# Altium project Vibration_Datalogger.PrjPcb (part 3 of 7)
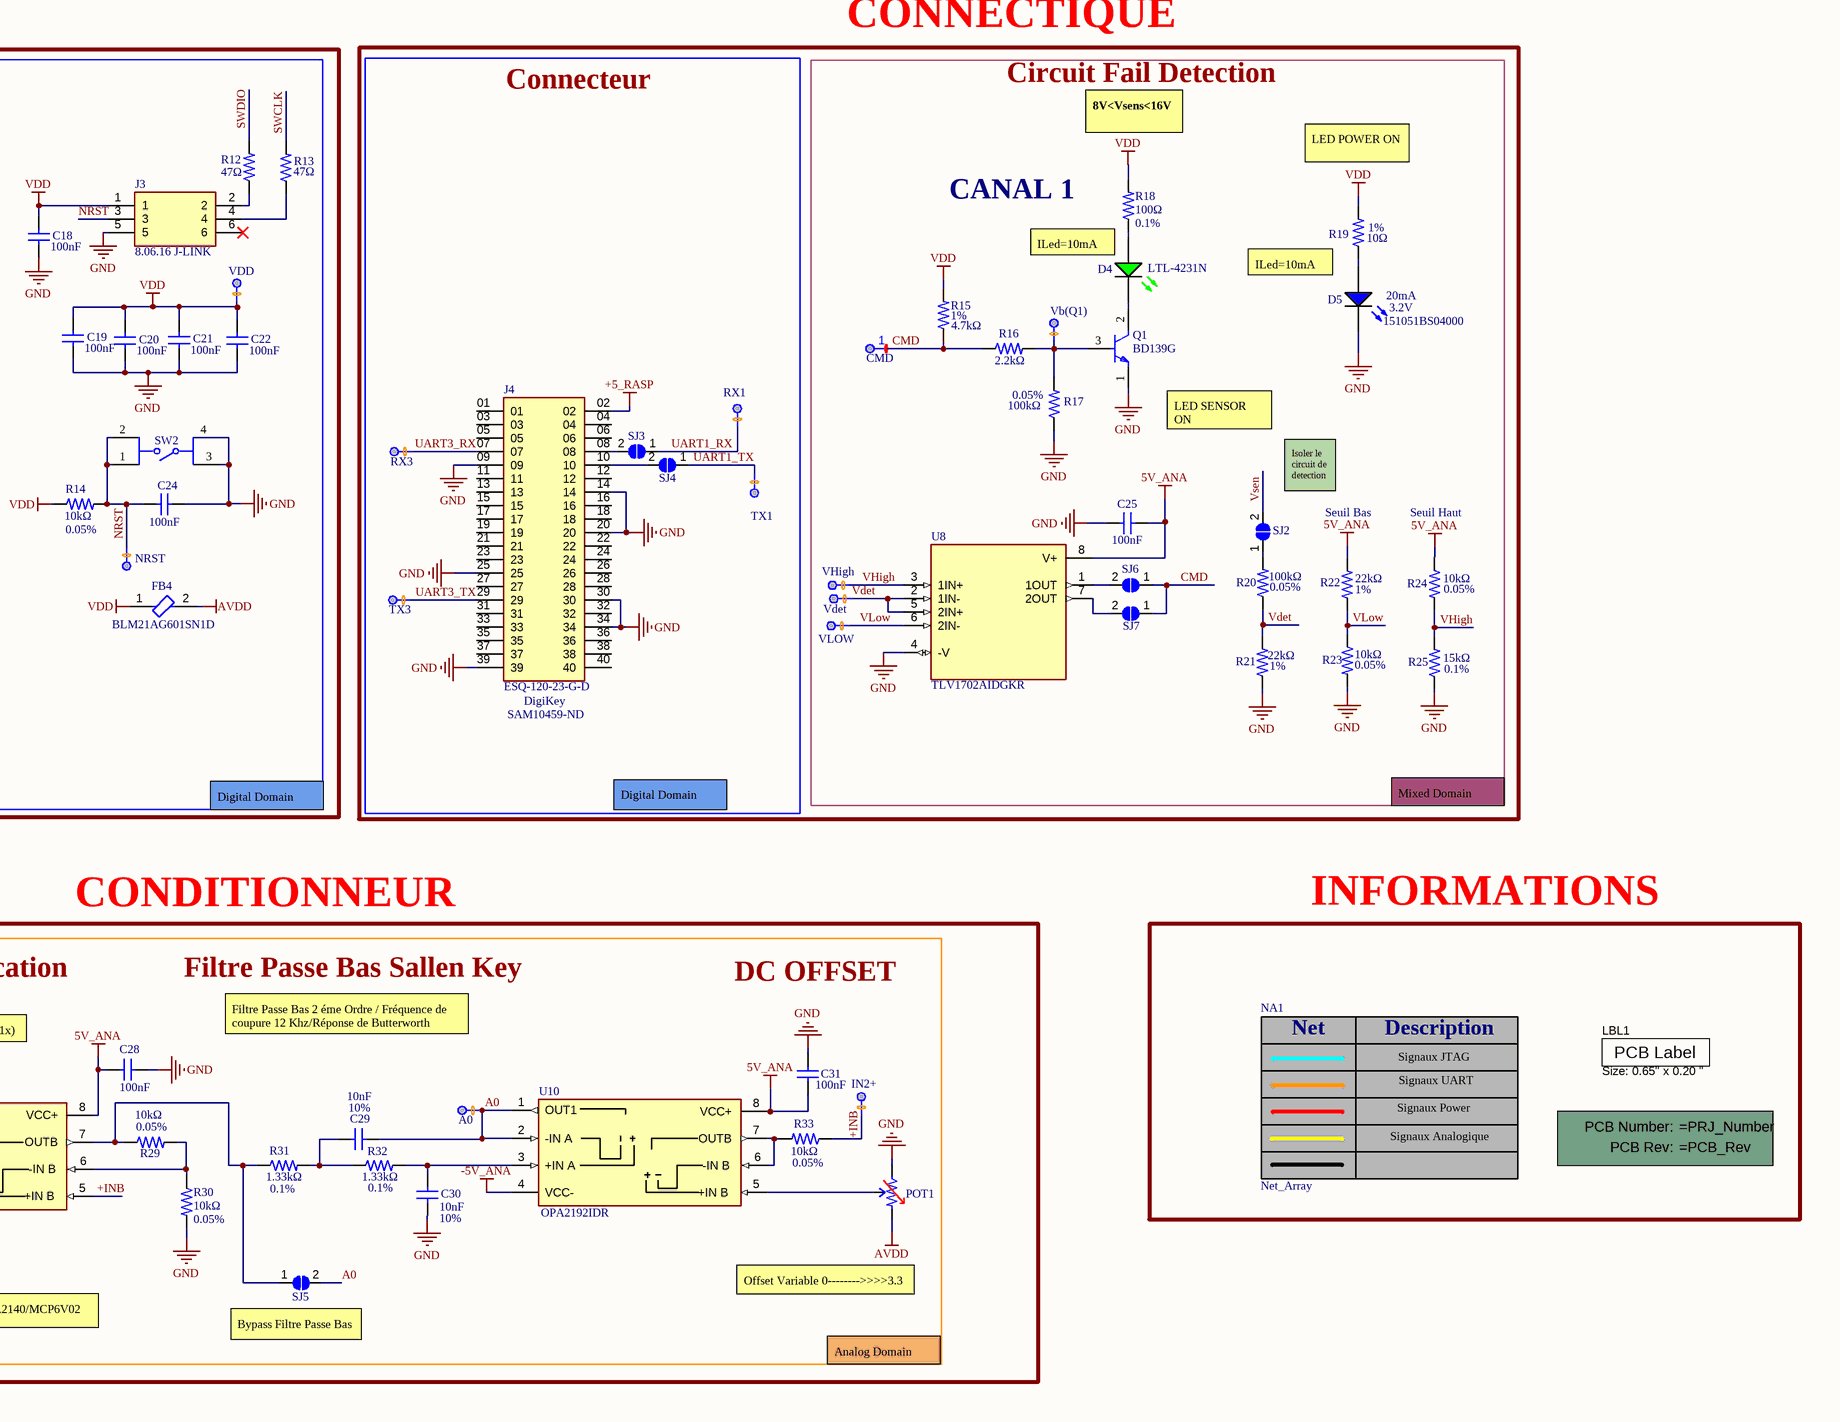
[diagram p5: Vibration_Datalogger_1.SchDoc, bottom right]

## Sheet Vibration_Datalogger_1.SchDoc: Title (continued)

### Library data of the parts (continued)
C27 C28 C31 = CC0402KRX7R7BB104: CAP CER 0.1UF 16V X7R 0402; Manufacturer: Yageo Group; Dielectric Material: Ceramic; Temperature Coefficient: 30ppm/°C; Tolerance: 10%; Case/Package: 0402; Case Code (Imperial): 0402; Case Code (Metric): 1005; China RoHS: Compliant; Composition: Ceramic; Country of Origin: Mainland China, Taiwan; Depth: 500µm; Export Control Classification Number (ECCN) Code: EAR99; Halogen Free: Halogen Free; Height: 500µm; Harmonized Tariff Schedule (HTS) Code: 8532.24.00.20; Introduction Date: 2009-04-17; Lead Free: Lead Free; Length: 1mm; Lifecycle Status: Production; Material: Ceramic; Max Operating Temperature: 125°C; Min Operating Temperature: -55°C; Mount: Surface Mount; Number of Pins: 2; Number of Terminals: 2; Radiation Hardening: No; REACH SVHC: Yes; Schedule B: 8532240020, 8532240020|8532240020, 8532240020|8532240020|8532240020, 8532240020|8532240020|8532240020|8532240020; Termination: SMD/SMT; Thickness: 558.8µm; Voltage Rating: 16V; Voltage Rating (AC): 16V; Voltage Rating (DC): 16V; Width: 500µm; ComponentLink1URL: https://datasheet.octopart.com:443/CC0402KRX7R7BB104-Yageo-datasheet-177165144.pdf?src-supplier=IHS; ComponentLink1Description: https://datasheet.octopart.com:443/CC0402KRX7R7BB104-Yageo-datasheet-177165144.pdf?src-supplier=IHS; ComponentLink2URL: https://datasheet.octopart.com/CC0402KRX7R7BB104-Yageo-datasheet-10883670.pdf; ComponentLink2Description: https://datasheet.octopart.com/CC0402KRX7R7BB104-Yageo-datasheet-10883670.pdf; ComponentLink3URL: https://datasheet.octopart.com/CC0402KRX7R7BB104-Yageo-datasheet-12526321.pdf; ComponentLink3Description: https://datasheet.octopart.com/CC0402KRX7R7BB104-Yageo-datasheet-12526321.pdf; ComponentLink4URL: https://datasheet.octopart.com:443/CC0402KRX7R7BB104-Yageo-datasheet-82288757.pdf?src-supplier=Upverter; ComponentLink4Description: https://datasheet.octopart.com:443/CC0402KRX7R7BB104-Yageo-datasheet-82288757.pdf?src-supplier=Upverter; ComponentLink5URL: https://datasheet.octopart.com:443/CC0402KRX7R7BB104-Yageo-datasheet-78855684.pdf?src-supplier=Upverter; ComponentLink5Description: https://datasheet.octopart.com:443/CC0402KRX7R7BB104-Yageo-datasheet-78855684.pdf?src-supplier=Upverter; ComponentLink6URL: https://datasheet.octopart.com:443/CC0402KRX7R7BB104-Yageo-datasheet-68298032.pdf?src-supplier=Upverter; ComponentLink6Description: https://datasheet.octopart.com:443/CC0402KRX7R7BB104-Yageo-datasheet-68298032.pdf?src-supplier=Upverter; ComponentLink7URL: https://datasheet.octopart.com:443/CC0402KRX7R7BB104-Yageo-datasheet-181967370.pdf?src-supplier=Newark; ComponentLink7Description: https://datasheet.octopart.com:443/CC0402KRX7R7BB104-Yageo-datasheet-181967370.pdf?src-supplier=Newark; ComponentLink8URL: https://datasheet.octopart.com:443/CC0402KRX7R7BB104-Yageo-datasheet-181967368.pdf?src-supplier=Newark; ComponentLink8Description: https://datasheet.octopart.com:443/CC0402KRX7R7BB104-Yageo-datasheet-181967368.pdf?src-supplier=Newark; ComponentLink9URL: https://datasheet.octopart.com:443/CC0402KRX7R7BB104-Yageo-datasheet-499490.pdf?src-supplier=Newark; ComponentLink9Description: https://datasheet.octopart.com:443/CC0402KRX7R7BB104-Yageo-datasheet-499490.pdf?src-supplier=Newark; ComponentLink10URL: https://datasheet.octopart.com:443/CC0402KRX7R7BB104-Yageo-datasheet-519481.pdf?src-supplier=Newark; ComponentLink10Description: https://datasheet.octopart.com:443/CC0402KRX7R7BB104-Yageo-datasheet-519481.pdf?src-supplier=Newark; ComponentLink11URL: https://datasheet.octopart.com:443/CC0402KRX7R7BB104-Yageo-datasheet-182050774.pdf?src-supplier=Newark; ComponentLink11Description: https://datasheet.octopart.com:443/CC0402KRX7R7BB104-Yageo-datasheet-182050774.pdf?src-supplier=Newark; ComponentLink12URL: https://datasheet.octopart.com:443/CC0402KRX7R7BB104-Yageo-datasheet-62336348.pdf?src-supplier=Farnell; ComponentLink12Description: https://datasheet.octopart.com:443/CC0402KRX7R7BB104-Yageo-datasheet-62336348.pdf?src-supplier=Farnell; ComponentLink13URL: https://datasheet.octopart.com:443/CC0402KRX7R7BB104-Yageo-datasheet-151948686.pdf?src-supplier=Farnell; ComponentLink13Description: https://datasheet.octopart.com:443/CC0402KRX7R7BB104-Yageo-datasheet-151948686.pdf?src-supplier=Farnell; ComponentLink14URL: https://datasheet.octopart.com:443/CC0402KRX7R7BB104-Yageo-Group-datasheet-188689702.pdf?src-supplier=Farnell; ComponentLink14Description: https://datasheet.octopart.com:443/CC0402KRX7R7BB104-Yageo-Group-datasheet-188689702.pdf?src-supplier=Farnell; ComponentLink15URL: https://datasheet.octopart.com:443/CC0402KRX7R7BB104-Yageo-datasheet-8359971.pdf?src-supplier=Farnell; ComponentLink15Description: https://datasheet.octopart.com:443/CC0402KRX7R7BB104-Yageo-datasheet-8359971.pdf?src-supplier=Farnell; ComponentLink16URL: https://datasheet.octopart.com:443/CC0402KRX7R7BB104-Yageo-datasheet-500777.pdf?src-supplier=Farnell; ComponentLink16Description: https://datasheet.octopart.com:443/CC0402KRX7R7BB104-Yageo-datasheet-500777.pdf?src-supplier=Farnell; ComponentLink17URL: https://datasheet.octopart.com:443/CC0402KRX7R7BB104-Yageo-datasheet-137700084.pdf?src-supplier=Burklin+Elektronik; ComponentLink17Description: https://datasheet.octopart.com:443/CC0402KRX7R7BB104-Yageo-datasheet-137700084.pdf?src-supplier=Burklin+Elektronik; ComponentLink18URL: https://datasheet.octopart.com:443/CC0402KRX7R7BB104-Yageo-datasheet-27626582.pdf?src-supplier=Future+Electronics; ComponentLink18Description: https://datasheet.octopart.com:443/CC0402KRX7R7BB104-Yageo-datasheet-27626582.pdf?src-supplier=Future+Electronics; ComponentLink19URL: https://datasheet.octopart.com:443/CC0402KRX7R7BB104-Yageo-datasheet-166511530.pdf?src-supplier=Future+Electronics; ComponentLink19Description: https://datasheet.octopart.com:443/CC0402KRX7R7BB104-Yageo-datasheet-166511530.pdf?src-supplier=Future+Electronics; ComponentLink20URL: https://datasheet.octopart.com:443/CC0402KRX7R7BB104-Yageo-datasheet-137700082.pdf?src-supplier=Future+Electronics; ComponentLink20Description: https://datasheet.octopart.com:443/CC0402KRX7R7BB104-Yageo-datasheet-137700082.pdf?src-supplier=Future+Electronics; ComponentLink21URL: https://datasheet.octopart.com:443/CC0402KRX7R7BB104-Yageo-datasheet-24578986.pdf?src-supplier=Future+Electronics; ComponentLink21Description: https://datasheet.octopart.com:443/CC0402KRX7R7BB104-Yageo-datasheet-24578986.pdf?src-supplier=Future+Electronics; ComponentLink22URL: https://datasheet.octopart.com:443/CC0402KRX7R7BB104-Yageo-datasheet-10911834.pdf?src-supplier=Future+Electronics; ComponentLink22Description: https://datasheet.octopart.com:443/CC0402KRX7R7BB104-Yageo-datasheet-10911834.pdf?src-supplier=Future+Electronics; ComponentLink23URL: https://datasheet.octopart.com:443/CC0402KRX7R7BB104-Yageo-datasheet-8324442.pdf?src-supplier=Future+Electronics; ComponentLink23Description: https://datasheet.octopart.com:443/CC0402KRX7R7BB104-Yageo-datasheet-8324442.pdf?src-supplier=Future+Electronics; ComponentLink24URL: https://datasheet.octopart.com:443/CC0402KRX7R7BB104-Yageo-datasheet-15895757.pdf?src-supplier=element14+APAC; ComponentLink24Description: https://datasheet.octopart.com:443/CC0402KRX7R7BB104-Yageo-datasheet-15895757.pdf?src-supplier=element14+APAC; ComponentLink25URL: https://datasheet.octopart.com:443/CC0402KRX7R7BB104-Yageo-Group-datasheet-184163374.pdf?src-supplier=LCSC; ComponentLink25Description: https://datasheet.octopart.com:443/CC0402KRX7R7BB104-Yageo-Group-datasheet-184163374.pdf?src-supplier=LCSC; ComponentLink26URL: https://datasheet.octopart.com:443/CC0402KRX7R7BB104-Yageo-Group-datasheet-165992755.pdf?src-supplier=ODG+(Origin+Data+Global); ComponentLink26Description: https://datasheet.octopart.com:443/CC0402KRX7R7BB104-Yageo-Group-datasheet-165992755.pdf?src-supplier=ODG+(Origin+Data+Global); ComponentLink27URL: https://datasheet.octopart.com:443/CC0402KRX7R7BB104-Yageo-datasheet-140260305.pdf?src-supplier=SOS+electronic; ComponentLink27Description: https://datasheet.octopart.com:443/CC0402KRX7R7BB104-Yageo-datasheet-140260305.pdf?src-supplier=SOS+electronic; ComponentLink28URL: https://datasheet.octopart.com:443/CC0402KRX7R7BB104-Yageo-datasheet-151978998.pdf?src-supplier=SOS+electronic; ComponentLink28Description: https://datasheet.octopart.com:443/CC0402KRX7R7BB104-Yageo-datasheet-151978998.pdf?src-supplier=SOS+electronic; ComponentLink29URL: https://datasheet.octopart.com:443/CC0402KRX7R7BB104-Yageo-datasheet-8701427.pdf?src-supplier=element14; ComponentLink29Description: https://datasheet.octopart.com:443/CC0402KRX7R7BB104-Yageo-datasheet-8701427.pdf?src-supplier=element14; ComponentLink30URL: https://datasheet.octopart.com:443/CC0402KRX7R7BB104-Yageo-datasheet-5301394.pdf?src-supplier=element14; ComponentLink30Description: https://datasheet.octopart.com:443/CC0402KRX7R7BB104-Yageo-datasheet-5301394.pdf?src-supplier=element14; ComponentLink31URL: http://sigma.octopart.com:80/rohs_statement/Surface-Mount-Ceramic-Multilayer-Capacitors%3B-General-Purpose-%26-High-Capacitance-Class-2%2C-X7R-Yageo-family-124.pdf?src-supplier=Compliance+Statements; ComponentLink31Description: http://sigma.octopart.com:80/rohs_statement/Surface-Mount-Ceramic-Multilayer-Capacitors%3B-General-Purpose-%26-High-Capacitance-Class-2%2C-X7R-Yageo-family-124.pdf?src-supplier=Compliance+Statements; ComponentLink32URL: http://sigma.octopart.com:80/reach_statement/Surface-Mount-Ceramic-Multilayer-Capacitors%3B-General-Purpose-%26-High-Capacitance-Class-2%2C-X7R-Yageo-family-125.pdf?src-supplier=Compliance+Statements; ComponentLink32Description: http://sigma.octopart.com:80/reach_statement/Surface-Mount-Ceramic-Multilayer-Capacitors%3B-General-Purpose-%26-High-Capacitance-Class-2%2C-X7R-Yageo-family-125.pdf?src-supplier=Compliance+Statements; ComponentLink33URL: http://sigma.octopart.com:80/conflict_mineral_statement/Yageo-company-3.pdf?src-supplier=Compliance+Statements; ComponentLink33Description: http://sigma.octopart.com:80/conflict_mineral_statement/Yageo-company-3.pdf?src-supplier=Compliance+Statements; ComponentLink34URL: http://sigma.octopart.com:80/rohs_statement/Yageo-company-2.pdf?src-supplier=Compliance+Statements; ComponentLink34Description: http://sigma.octopart.com:80/rohs_statement/Yageo-company-2.pdf?src-supplier=Compliance+Statements; Supplier 1: DigiKey; Supplier Part Number 1: 311-1338-6-ND; Manufacturer Part Number: CC0402KRX7R7BB104; Category: Ceramic Capacitors; Voltage: 16V; Dielectric: X7R
C29 C30 = C0603C103K5RAC7411: CAP CER 10000PF 50V X7R 0603; Dielectric Material: Ceramic; Dissipation Factor: 2.5%; Temperature Coefficient: 30ppm/°C; Case/Package: 0603; Case Code (Imperial): 0603; Case Code (Metric): 1608; China RoHS: Compliant; Country of Origin: Mexico; Depth: 800µm; Dielectric: X7R; Export Control Classification Number (ECCN) Code: EAR99; Height: 800µm; Harmonized Tariff Schedule (HTS) Code: 8532.24.00.20; Introduction Date: 2011-03-01; Lead Pitch: 700µm; Length: 1.6mm; Lifecycle Status: Production; Material: Ceramic; Max Operating Temperature: 125°C; Min Operating Temperature: -55°C; Mount: Surface Mount; Number of Terminals: 2; Radiation Hardening: No; REACH SVHC: Yes; Schedule B: 8532240020, 8532240020|8532240020|8532240020|8532240020|8532240020; Termination: SMD/SMT; Voltage Rating: 50V; Voltage Rating (DC): 50V; Width: 800µm; ComponentLink1URL: https://datasheet.octopart.com:443/C0603C103K5RAC7411-KEMET-datasheet-178445679.pdf?src-supplier=IHS; ComponentLink1Description: https://datasheet.octopart.com:443/C0603C103K5RAC7411-KEMET-datasheet-178445679.pdf?src-supplier=IHS; ComponentLink2URL: https://datasheet.octopart.com:443/C0603C103K5RAC7411-KEMET-datasheet-137357764.pdf?src-supplier=Upverter; ComponentLink2Description: https://datasheet.octopart.com:443/C0603C103K5RAC7411-KEMET-datasheet-137357764.pdf?src-supplier=Upverter; ComponentLink3URL: https://datasheet.octopart.com:443/C0603C103K5RAC7411-KEMET-datasheet-149521829.pdf?src-supplier=Farnell; ComponentLink3Description: https://datasheet.octopart.com:443/C0603C103K5RAC7411-KEMET-datasheet-149521829.pdf?src-supplier=Farnell; ComponentLink4URL: https://datasheet.octopart.com:443/C0603C103K5RAC7411-KEMET-datasheet-137357759.pdf?src-supplier=Farnell; ComponentLink4Description: https://datasheet.octopart.com:443/C0603C103K5RAC7411-KEMET-datasheet-137357759.pdf?src-supplier=Farnell; ComponentLink5URL: https://datasheet.octopart.com:443/C0603C103K5RAC7411-KEMET-datasheet-157246124.pdf?src-supplier=Electro+Sonic; ComponentLink5Description: https://datasheet.octopart.com:443/C0603C103K5RAC7411-KEMET-datasheet-157246124.pdf?src-supplier=Electro+Sonic; ComponentLink6URL: https://datasheet.octopart.com:443/C0603C103K5RAC7411-KEMET-datasheet-37550250.pdf?src-supplier=Electro+Sonic; ComponentLink6Description: https://datasheet.octopart.com:443/C0603C103K5RAC7411-KEMET-datasheet-37550250.pdf?src-supplier=Electro+Sonic; ComponentLink7URL: https://datasheet.octopart.com:443/C0603C103K5RAC7411-KEMET-datasheet-188512054.pdf?src-supplier=ODG+(Origin+Data+Global); ComponentLink7Description: https://datasheet.octopart.com:443/C0603C103K5RAC7411-KEMET-datasheet-188512054.pdf?src-supplier=ODG+(Origin+Data+Global); ComponentLink8URL: https://datasheet.octopart.com:443/C0603C103K5RAC7411-KEMET-datasheet-166018733.pdf?src-supplier=Newark; ComponentLink8Description: https://datasheet.octopart.com:443/C0603C103K5RAC7411-KEMET-datasheet-166018733.pdf?src-supplier=Newark; ComponentLink9URL: https://datasheet.octopart.com:443/C0603C103K5RAC7411-KEMET-datasheet-137045076.pdf?src-supplier=TME; ComponentLink9Description: https://datasheet.octopart.com:443/C0603C103K5RAC7411-KEMET-datasheet-137045076.pdf?src-supplier=TME; ComponentLink10URL: https://datasheet.octopart.com:443/C0603C103K5RAC7411-KEMET-datasheet-130256537.pdf?src-supplier=TME; ComponentLink10Description: https://datasheet.octopart.com:443/C0603C103K5RAC7411-KEMET-datasheet-130256537.pdf?src-supplier=TME; ComponentLink11URL: https://datasheet.octopart.com/C0603C103K5RAC7411-KEMET-datasheet-84169754.pdf; ComponentLink11Description: https://datasheet.octopart.com/C0603C103K5RAC7411-KEMET-datasheet-84169754.pdf; ComponentLink12URL: https://datasheet.octopart.com:443/C0603C103K5RAC7411-Kemet-datasheet-11777752.pdf?src-supplier=Arrow+Electronics; ComponentLink12Description: https://datasheet.octopart.com:443/C0603C103K5RAC7411-Kemet-datasheet-11777752.pdf?src-supplier=Arrow+Electronics; ComponentLink13URL: https://datasheet.octopart.com:443/C0603C103K5RAC7411-Kemet-datasheet-5313890.pdf?src-supplier=Verical; ComponentLink13Description: https://datasheet.octopart.com:443/C0603C103K5RAC7411-Kemet-datasheet-5313890.pdf?src-supplier=Verical; ComponentLink14URL: https://datasheet.octopart.com:443/C0603C103K5RAC-7411-Kemet-datasheet-7834772.pdf?src-supplier=Jameco; ComponentLink14Description: https://datasheet.octopart.com:443/C0603C103K5RAC-7411-Kemet-datasheet-7834772.pdf?src-supplier=Jameco; ComponentLink15URL: http://sigma.octopart.com:80/conflict_mineral_statement/Yageo-company-3.pdf?src-supplier=Compliance+Statements; ComponentLink15Description: http://sigma.octopart.com:80/conflict_mineral_statement/Yageo-company-3.pdf?src-supplier=Compliance+Statements; ComponentLink16URL: http://sigma.octopart.com:80/rohs_statement/Yageo-company-2.pdf?src-supplier=Compliance+Statements; ComponentLink16Description: http://sigma.octopart.com:80/rohs_statement/Yageo-company-2.pdf?src-supplier=Compliance+Statements; Supplier 1: DigiKey; Supplier Part Number 1: 399-17254-6-ND
D1 D2 = CUS05S40,H3F: DIODE SCHOTTKY 40V 500MA USC
D3 = BAS40-04: DIODE ARR SCHOTT 40V 200MA SOT23; Average Rectified Current: 120mA; Capacitance: 5pF; Element Configuration: Dual; Forward Voltage: 380mV; Max Power Dissipation: 250mW; Max Reverse Leakage Current: 1µA; Number of Elements: 2; Recovery Time: 100ps; Reverse Standoff Voltage: 30V; Case/Package: SOT; China RoHS: Compliant; Contact Plating: Tin; Country of Origin: Austria, Mainland China; Export Control Classification Number (ECCN) Code: EAR99; Forward Current: 120mA; Halogen Free: Not Halogen Free; Height: 900µm; Harmonized Tariff Schedule (HTS) Code: 8541.10.00.70; Introduction Date: 1996-02-01; Lead Free: Lead Free; Length: 2.9mm; Lifecycle Status: Production; Max Forward Surge Current (Ifsm): 200mA; Max Operating Temperature: 150°C; Max Output Current: 120mA; Max Repetitive Reverse Voltage (Vrrm): 40V; Max Reverse Voltage (DC): 40V; Max Surge Current: 200mA; Min Breakdown Voltage: 40V; Min Operating Temperature: -55°C; Mount: Surface Mount; Number of Pins: 3; Number of Terminals: 3; Package Quantity: 3000; Packaging: Tape & Reel; Peak Non-Repetitive Surge Current: 200mA; Peak Reverse Current: 1µA; Radiation Hardening: No; Ratings: AEC-Q101; REACH SVHC: Yes; Reverse Recovery Time: 100ps; Reverse Voltage: 40V; Schedule B: 8541100070|8541100070|8541100070, 8541100080|8541100080|8541100080|8541100080|8541100080|8541100080|8541100080|8541100080|8541100080|8541100080|8541100080|8541100080|8541100080|8541100080|8541100080|8541100080|8541100080, 8541100080|8541100080|8541100080|8541100080|8541100080|8541100080|8541100080|8541100080|8541100080|8541100080|8541100080|8541100080|8541100080|8541100080|8541100080|8541100080|8541100080|8541100080, 8541100080|8541100080|8541100080|8541100080|8541100080|8541100080|8541100080|8541100080|8541100080|8541100080|8541100080|8541100080|8541100080|8541100080|8541100080|8541100080|8541100080|8541100080|8541100080; Termination: SMD/SMT; Width: 1.3mm; ComponentLink1URL: https://datasheet.octopart.com:443/BAS4004E6327HTSA1-Infineon-datasheet-38586392.pdf?src-supplier=Newark; ComponentLink1Description: https://datasheet.octopart.com:443/BAS4004E6327HTSA1-Infineon-datasheet-38586392.pdf?src-supplier=Newark; ComponentLink2URL: https://datasheet.octopart.com:443/BAS4004E6327HTSA1-Infineon-datasheet-5318301.pdf?src-supplier=_legacy+Avnet; ComponentLink2Description: https://datasheet.octopart.com:443/BAS4004E6327HTSA1-Infineon-datasheet-5318301.pdf?src-supplier=_legacy+Avnet; ComponentLink3URL: https://datasheet.octopart.com:443/BAS4004E6327-Infineon-datasheet-537799.pdf?src-supplier=Farnell; ComponentLink3Description: https://datasheet.octopart.com:443/BAS4004E6327-Infineon-datasheet-537799.pdf?src-supplier=Farnell; ComponentLink4URL: https://datasheet.octopart.com:443/BAS4004E6327-Infineon-datasheet-7537246.pdf?src-supplier=Farnell; ComponentLink4Description: https://datasheet.octopart.com:443/BAS4004E6327-Infineon-datasheet-7537246.pdf?src-supplier=Farnell; ComponentLink5URL: https://datasheet.octopart.com:443/BAS40-04-Infineon-datasheet-578246.pdf?src-supplier=Farnell; ComponentLink5Description: https://datasheet.octopart.com:443/BAS40-04-Infineon-datasheet-578246.pdf?src-supplier=Farnell; ComponentLink6URL: https://datasheet.octopart.com:443/BAS40-04-Infineon-datasheet-645037.pdf?src-supplier=Farnell; ComponentLink6Description: https://datasheet.octopart.com:443/BAS40-04-Infineon-datasheet-645037.pdf?src-supplier=Farnell; ComponentLink7URL: https://datasheet.octopart.com:443/BAS4004E6327-Infineon-datasheet-21681.pdf?src-supplier=DigiKey; ComponentLink7Description: https://datasheet.octopart.com:443/BAS4004E6327-Infineon-datasheet-21681.pdf?src-supplier=DigiKey; ComponentLink8URL: http://sigma.octopart.com:80/conflict_mineral_statement/Infineon-company-51.pdf?src-supplier=Compliance+Statements; ComponentLink8Description: http://sigma.octopart.com:80/conflict_mineral_statement/Infineon-company-51.pdf?src-supplier=Compliance+Statements; ComponentLink9URL: http://sigma.octopart.com:80/reach_statement/International-Rectifier-company-55.pdf?src-supplier=Compliance+Statements; ComponentLink9Description: http://sigma.octopart.com:80/reach_statement/International-Rectifier-company-55.pdf?src-supplier=Compliance+Statements; ComponentLink10URL: http://sigma.octopart.com:80/rohs_statement/International-Rectifier-company-54.pdf?src-supplier=Compliance+Statements; ComponentLink10Description: http://sigma.octopart.com:80/rohs_statement/International-Rectifier-company-54.pdf?src-supplier=Compliance+Statements; Supplier 1: DigiKey; Supplier Part Number 1: BAS4004E6327HTSA1DKR-ND
D4 = LTL-4231N: LED GREEN DIFFUSED T/H; Supplier 1: DigiKey; Supplier Part Number 1: 160-1142-ND
D5 = 151051BS04000: Single Color LED, Blue, Diffused, T-1 3/4, 4.9mm; Manufacturer Lifecycle Status: ACTIVE; Manufacturer: Wurth Elektronik; Dominant Wavelength: 470nm; Forward Current: 100mA; Lens Size: 5mm; Lens Style: Circular, Diffused, Round; Luminous Intensity: 500mcd; Max Reverse Voltage (DC): 5V; Peak Wavelength: 465nm; Viewing Angle: 40°; YEOL: 1 = Estimated lifetime > 10 years; Case/Package: Radial; Color: Blue; Height: 8.6mm; Length: 5mm; Lifecycle Status: Production; Max Operating Temperature: 85°C; Min Operating Temperature: -40°C; Mount: Through Hole; Packaging: Bulk; REACH SVHC: Unknown; Wavelength: 470nm; Width: 5mm; ComponentLink1URL: https://datasheet.octopart.com:443/151051BS04000-Wurth-Elektronik-datasheet-168474691.pdf?src-supplier=Wurth+Elektronik; ComponentLink1Description: https://datasheet.octopart.com:443/151051BS04000-Wurth-Elektronik-datasheet-168474691.pdf?src-supplier=Wurth+Elektronik; ComponentLink2URL: https://datasheet.octopart.com:443/151051BS04000-W%C3%BCrth-Elektronik-datasheet-41196471.pdf?src-supplier=Future+Electronics; ComponentLink2Description: https://datasheet.octopart.com:443/151051BS04000-W%C3%BCrth-Elektronik-datasheet-41196471.pdf?src-supplier=Future+Electronics; ComponentLink3URL: https://datasheet.octopart.com:443/151051BS04000-W%C3%BCrth-Elektronik-datasheet-15983823.pdf?src-supplier=HQonline; ComponentLink3Description: https://datasheet.octopart.com:443/151051BS04000-W%C3%BCrth-Elektronik-datasheet-15983823.pdf?src-supplier=HQonline; Supplier 1: DigiKey; Supplier Part Number 1: 732-5015-ND; Manufacturer Part Number: 151051BS04000; Category: LEDs
FB1-FB3 = BLM21PG221SN1D: FERRITE BEAD 220 OHM 0805 1LN; Manufacturer Package Identifier: 0805 (2012 metric); Manufacturer: Murata; Current: 2A; DC Resistance (DCR): 50mΩ; Material: Ferrite, Steel; Number of Circuits: 1; Series Resistance: 45mΩ; Shielding: Unshielded; Tolerance: 25%; Case/Package: 0805; Case Code (Imperial): 0805; Case Code (Metric): 2012; Contact Plating: Tin; Core Material: Ferrite; Current Rating: 2A; DC Current: 2A; Depth: 1.25mm; Height: 850µm; Lead Free: Lead Free; Length: 2mm; Lifecycle Status: Production; Max Current Rating: 2A; Max DC Current: 2A; Max Frequency: 100MHz; Max Operating Temperature: 125°C; Military Standard: Not; Min Operating Temperature: -55°C; Mount: Surface Mount; Number of Lines: 1; Number of Pins: 2; Number of Terminals: 2; Packaging: Tape and Reel; Radiation Hardening: No; REACH SVHC: Yes; Resistance: 220Ω; RMS Current (Irms): 2A; Schedule B: 8504500000, 8504500000|8504500000|8504500000|8504500000|8504500000; Termination: SMD/SMT; Test Frequency: 100MHz; Width: 1.25mm; ComponentLink1URL: https://datasheet.octopart.com:443/BLM21PG221SN1D-Murata-datasheet-114786051.pdf?src-supplier=Upverter; ComponentLink1Description: https://datasheet.octopart.com:443/BLM21PG221SN1D-Murata-datasheet-114786051.pdf?src-supplier=Upverter; ComponentLink2URL: https://datasheet.octopart.com:443/BLM21PG221SN1D-Murata-datasheet-12522583.pdf?src-supplier=Upverter; ComponentLink2Description: https://datasheet.octopart.com:443/BLM21PG221SN1D-Murata-datasheet-12522583.pdf?src-supplier=Upverter; ComponentLink3URL: https://datasheet.octopart.com:443/BLM21PG221SN1D-Murata-datasheet-10083551.pdf?src-supplier=Upverter; ComponentLink3Description: https://datasheet.octopart.com:443/BLM21PG221SN1D-Murata-datasheet-10083551.pdf?src-supplier=Upverter; ComponentLink4URL: https://datasheet.octopart.com:443/BLM21PG221SN1D-Murata-datasheet-8508678.pdf?src-supplier=Upverter; ComponentLink4Description: https://datasheet.octopart.com:443/BLM21PG221SN1D-Murata-datasheet-8508678.pdf?src-supplier=Upverter; ComponentLink5URL: https://datasheet.octopart.com:443/BLM21PG221SN1D-Murata-datasheet-166171482.pdf?src-supplier=IHS; ComponentLink5Description: https://datasheet.octopart.com:443/BLM21PG221SN1D-Murata-datasheet-166171482.pdf?src-supplier=IHS; ComponentLink6URL: https://datasheet.octopart.com:443/BLM21PG221SN1D-Murata-datasheet-11743916.pdf?src-supplier=SOS+electronic; ComponentLink6Description: https://datasheet.octopart.com:443/BLM21PG221SN1D-Murata-datasheet-11743916.pdf?src-supplier=SOS+electronic; ComponentLink7URL: https://datasheet.octopart.com:443/BLM21PG221SN1D-Murata-datasheet-37129980.pdf?src-supplier=element14+APAC; ComponentLink7Description: https://datasheet.octopart.com:443/BLM21PG221SN1D-Murata-datasheet-37129980.pdf?src-supplier=element14+APAC; ComponentLink8URL: https://datasheet.octopart.com:443/BLM21PG221SN1D-Murata-datasheet-53019.pdf?src-supplier=TME; ComponentLink8Description: https://datasheet.octopart.com:443/BLM21PG221SN1D-Murata-datasheet-53019.pdf?src-supplier=TME; ComponentLink9URL: https://datasheet.octopart.com:443/BLM21PG221SN1D-Murata-datasheet-135086726.pdf?src-supplier=TME; ComponentLink9Description: https://datasheet.octopart.com:443/BLM21PG221SN1D-Murata-datasheet-135086726.pdf?src-supplier=TME; ComponentLink10URL: https://datasheet.octopart.com:443/BLM21PG221SN1D-Murata-datasheet-8359900.pdf?src-supplier=_legacy+Avnet; ComponentLink10Description: https://datasheet.octopart.com:443/BLM21PG221SN1D-Murata-datasheet-8359900.pdf?src-supplier=_legacy+Avnet; ComponentLink11URL: https://datasheet.octopart.com:443/BLM21PG221SN1D-Murata-datasheet-554271.pdf?src-supplier=_legacy+Avnet; ComponentLink11Description: https://datasheet.octopart.com:443/BLM21PG221SN1D-Murata-datasheet-554271.pdf?src-supplier=_legacy+Avnet; ComponentLink12URL: https://datasheet.octopart.com:443/BLM21PG221SN1D-Murata-datasheet-141258121.pdf?src-supplier=Ciiva; ComponentLink12Description: https://datasheet.octopart.com:443/BLM21PG221SN1D-Murata-datasheet-141258121.pdf?src-supplier=Ciiva; ComponentLink13URL: https://datasheet.octopart.com:443/BLM21PG221SN1D-Murata-datasheet-138707416.pdf?src-supplier=Ciiva; ComponentLink13Description: https://datasheet.octopart.com:443/BLM21PG221SN1D-Murata-datasheet-138707416.pdf?src-supplier=Ciiva; ComponentLink14URL: https://datasheet.octopart.com:443/BLM21PG221SN1D-Murata-datasheet-83134203.pdf?src-supplier=Megastar; ComponentLink14Description: https://datasheet.octopart.com:443/BLM21PG221SN1D-Murata-datasheet-83134203.pdf?src-supplier=Megastar; ComponentLink15URL: https://datasheet.octopart.com:443/BLM21PG221SN1D-Murata-datasheet-62086381.pdf?src-supplier=Future+Electronics; ComponentLink15Description: https://datasheet.octopart.com:443/BLM21PG221SN1D-Murata-datasheet-62086381.pdf?src-supplier=Future+Electronics; ComponentLink16URL: https://datasheet.octopart.com:443/BLM21PG221SN1D-Murata-datasheet-14066484.pdf?src-supplier=iiiC; ComponentLink16Description: https://datasheet.octopart.com:443/BLM21PG221SN1D-Murata-datasheet-14066484.pdf?src-supplier=iiiC; ComponentLink17URL: https://datasheet.octopart.com:443/BLM21PG221SN1D-Murata-datasheet-8197962.pdf?src-supplier=Jameco; ComponentLink17Description: https://datasheet.octopart.com:443/BLM21PG221SN1D-Murata-datasheet-8197962.pdf?src-supplier=Jameco; ComponentLink18URL: https://datasheet.octopart.com:443/BLM21PG221SN1D-Murata-datasheet-153769.pdf?src-supplier=Mouser; ComponentLink18Description: https://datasheet.octopart.com:443/BLM21PG221SN1D-Murata-datasheet-153769.pdf?src-supplier=Mouser; ComponentLink19URL: http://sigma.octopart.com:80/reach_statement/Murata-company-16.pdf?src-supplier=Compliance+Statements; ComponentLink19Description: http://sigma.octopart.com:80/reach_statement/Murata-company-16.pdf?src-supplier=Compliance+Statements; Supplier 1: DigiKey; Supplier Part Number 1: 490-1054-1-ND; Manufacturer Part Number: BLM21PG221SN1D; Category: Ferrite Beads and Chips
FB4 = CMP-0686-00639-3: Chip Ferrite Bead, 0805, 600Ω @ 100MHz, 0.2Ω, 25%, 700mA; Material: Steel; DC Current: 200mA; Impedance: 600R; Current Rating: 600mA; Number of Circuits: 1; Shielding: Unshielded; DC Resistance (DCR): 210mR; Temperature Coefficient: 10ppm/°C; Conductor Material: Copper; Radiation Hardening: No; Test Frequency: 100MHz; Height: 0.85mm; Max Current Rating: 700mA; REACH SVHC: No SVHC; Case Code (Metric): 2012; Max DC Current: 200mA; Min Operating Temperature: -55°C; ESR (Equivalent Series Resistance): 600R; Case/Package: 0805; Tolerance: 25%; Number of Pins: 2; Depth: 1.25mm; Lead Free: Lead Free; Frequency: 100MHz; Length: 2mm; Package Quantity: 1; Max Operating Temperature: 125°C; Case Code (Imperial): 0805; Width: 1.25mm; Core Material: Ferrite; RoHS Compliant: Yes; Termination: SMD/SMT; Number of Lines: 1; Packaging: Tape and Reel
J1 = 691411410002: WR-TBL Terminal block - Screwless Push IN - THT; Manufacturer Lifecycle Status: ACTIVE; Manufacturer: Wurth Elektronik; Current Rating: 10A; Number of Contacts: 2; Pitch: 7.62mm; Voltage Rating: 300V; YEOL: 1 = Estimated lifetime > 10 years; Contact Material: Nickel, Tin; Height: 14mm; Lead Pitch: 7.62mm; Length: 14.24mm; Lifecycle Status: Production; Max Operating Temperature: 120°C; Min Operating Temperature: -30°C; Number of Pins: 2; Number of Rows: 1; Packaging: Box; ComponentLink1URL: https://datasheet.octopart.com:443/691411410002-W%C3%BCrth-Elektronik-datasheet-117282770.pdf?src-supplier=HQonline; ComponentLink1Description: https://datasheet.octopart.com:443/691411410002-W%C3%BCrth-Elektronik-datasheet-117282770.pdf?src-supplier=HQonline; ComponentLink2URL: https://datasheet.octopart.com:443/691411410002-Wurth-Elektronik-datasheet-190368166.pdf?src-supplier=Wurth+Elektronik; ComponentLink2Description: https://datasheet.octopart.com:443/691411410002-Wurth-Elektronik-datasheet-190368166.pdf?src-supplier=Wurth+Elektronik; Supplier 1: DigiKey; Supplier Part Number 1: 732-11084-ND; Manufacturer Part Number: 691411410002; Category: Terminal Blocks
J2 = 0022288032: CONN HEADER R/A 3POS 2.54MM; Manufacturer Lifecycle Status: ACTIVE; Connector Type: Male Pin; Contact Resistance: 20mΩ; Current Rating: 4A; Gender: Male; Glow Wire Compliant: Non-compliant; Insulation Resistance: 50GΩ; Max Voltage Rating (DC): 250.25kV; Number of Circuits: 3; Plating: Tin; Plating Thickness: 381nm; Ratings: CSA; Voltage Rating: 250V; China RoHS: Compliant; Color: Black; Contact Material: Brass; Contact Mating Length: 6.1976mm; Contact Plating: Gold; Country of Origin: US; Export Control Classification Number (ECCN) Code: EAR99; Housing Color: Black; Housing Material: Thermoplastic; Harmonized Tariff Schedule (HTS) Code: 8536.69.40.40; Introduction Date: 1994-12-01; Lead Free: Lead Free; Length: 7.62mm; Lifecycle Status: Production; Max Operating Temperature: 75°C; Min Operating Temperature: -40°C; Mount: Through Hole; Number of Contacts: 3; Number of Pins: 3; Number of Positions: 3; Number of Rows: 1; Orientation: Right Angle; Packaging: Bulk; Pitch: 2.54mm; REACH SVHC: Yes; Terminal Pitch: 2.54mm; Termination: Solder; ComponentLink1URL: https://datasheet.octopart.com:443/22-28-8032-Molex-datasheet-158885819.pdf?src-supplier=Newark; ComponentLink1Description: https://datasheet.octopart.com:443/22-28-8032-Molex-datasheet-158885819.pdf?src-supplier=Newark; ComponentLink2URL: https://datasheet.octopart.com:443/22-28-8032-Molex-datasheet-193086131.pdf?src-supplier=JRH+Electronics; ComponentLink2Description: https://datasheet.octopart.com:443/22-28-8032-Molex-datasheet-193086131.pdf?src-supplier=JRH+Electronics; ComponentLink3URL: https://datasheet.octopart.com:443/22-28-8032-Molex-datasheet-16301320.pdf?src-supplier=Molex; ComponentLink3Description: https://datasheet.octopart.com:443/22-28-8032-Molex-datasheet-16301320.pdf?src-supplier=Molex; ComponentLink4URL: https://sigma.octopart.com:443/12577388/technical_drawing/Molex-22-28-8032.pdf?src-supplier=Molex; ComponentLink4Description: https://sigma.octopart.com:443/12577388/technical_drawing/Molex-22-28-8032.pdf?src-supplier=Molex; ComponentLink5URL: https://datasheet.octopart.com:443/022288032-Molex-datasheet-8335722.pdf?src-supplier=Molex; ComponentLink5Description: https://datasheet.octopart.com:443/022288032-Molex-datasheet-8335722.pdf?src-supplier=Molex; ComponentLink6URL: https://datasheet.octopart.com:443/22-28-8032-Molex-datasheet-154747357.pdf?src-supplier=Master+Electronics; ComponentLink6Description: https://datasheet.octopart.com:443/22-28-8032-Molex-datasheet-154747357.pdf?src-supplier=Master+Electronics; ComponentLink7URL: https://datasheet.octopart.com:443/22-28-8032-Molex-datasheet-140181327.pdf?src-supplier=RS+(Formerly+Allied+Electronics); ComponentLink7Description: https://datasheet.octopart.com:443/22-28-8032-Molex-datasheet-140181327.pdf?src-supplier=RS+(Formerly+Allied+Electronics); ComponentLink8URL: https://datasheet.octopart.com:443/22-28-8032-Molex-datasheet-120146392.pdf?src-supplier=RS+(Formerly+Allied+Electronics); ComponentLink8Description: https://datasheet.octopart.com:443/22-28-8032-Molex-datasheet-120146392.pdf?src-supplier=RS+(Formerly+Allied+Electronics); ComponentLink9URL: https://datasheet.octopart.com:443/22-28-8032-Molex-datasheet-62061378.pdf?src-supplier=RS+(Formerly+Allied+Electronics); ComponentLink9Description: https://datasheet.octopart.com:443/22-28-8032-Molex-datasheet-62061378.pdf?src-supplier=RS+(Formerly+Allied+Electronics); ComponentLink10URL: https://datasheet.octopart.com:443/22-28-8032-Molex-datasheet-62103598.pdf?src-supplier=Electro+Sonic; ComponentLink10Description: https://datasheet.octopart.com:443/22-28-8032-Molex-datasheet-62103598.pdf?src-supplier=Electro+Sonic; ComponentLink11URL: https://datasheet.octopart.com:443/22-28-8032-Molex-datasheet-37169007.pdf?src-supplier=Electro+Sonic; ComponentLink11Description: https://datasheet.octopart.com:443/22-28-8032-Molex-datasheet-37169007.pdf?src-supplier=Electro+Sonic; ComponentLink12URL: https://datasheet.octopart.com:443/22-28-8032-Molex-datasheet-23709161.pdf?src-supplier=Electro+Sonic; ComponentLink12Description: https://datasheet.octopart.com:443/22-28-8032-Molex-datasheet-23709161.pdf?src-supplier=Electro+Sonic; ComponentLink13URL: https://datasheet.octopart.com:443/0022288032-Molex-datasheet-11837251.pdf?src-supplier=Arrow+Electronics; ComponentLink13Description: https://datasheet.octopart.com:443/0022288032-Molex-datasheet-11837251.pdf?src-supplier=Arrow+Electronics; ComponentLink14URL: https://datasheet.octopart.com:443/22-28-8032-Molex-datasheet-147203.pdf?src-supplier=DigiKey; ComponentLink14Description: https://datasheet.octopart.com:443/22-28-8032-Molex-datasheet-147203.pdf?src-supplier=DigiKey; ComponentLink15URL: http://sigma.octopart.com:80/16301321/rohs_statement/Molex-22-28-8032.pdf?src-supplier=Compliance+Statements; ComponentLink15Description: http://sigma.octopart.com:80/16301321/rohs_statement/Molex-22-28-8032.pdf?src-supplier=Compliance+Statements; ComponentLink16URL: http://sigma.octopart.com:80/reach_statement/Molex-company-74.pdf?src-supplier=Compliance+Statements; ComponentLink16Description: http://sigma.octopart.com:80/reach_statement/Molex-company-74.pdf?src-supplier=Compliance+Statements; ComponentLink17URL: http://sigma.octopart.com:80/rohs_statement/Molex-company-73.pdf?src-supplier=Compliance+Statements; ComponentLink17Description: http://sigma.octopart.com:80/rohs_statement/Molex-company-73.pdf?src-supplier=Compliance+Statements; ComponentLink18URL: http://sigma.octopart.com:80/conflict_mineral_statement/Molex-company-72.pdf?src-supplier=Compliance+Statements; ComponentLink18Description: http://sigma.octopart.com:80/conflict_mineral_statement/Molex-company-72.pdf?src-supplier=Compliance+Statements; Supplier 1: DigiKey; Supplier Part Number 1: WM50015-03-ND
J3 = 8.06.16 J-LINK: 6-pin Needle Adapter (8.06.16)
J4 = ESQ-120-23-G-D: CONN SOCKET 40POS 0.1 GOLD PCB
L1 = 74438357100: 10 µH Shielded Molded Inductor 2.7 A; Manufacturer Lifecycle Status: ACTIVE; Manufacturer: Wurth Elektronik; Current Rating: 2.7A; DC Resistance (DCR): 100.8mΩ; Saturation Current: 3A; Self Resonant Frequency: 15MHz; Series Resistance: 110mΩ; Test Frequency: 100kHz; YEOL: 1 = Estimated lifetime > 10 years; Ambient Temperature Range High: 85°C; Ambient Temperature Range Low: -40°C; Height: 3.1mm; Length: 4mm; Lifecycle Status: Production; Max Operating Temperature: 125°C; Min Operating Temperature: -40°C; Number of Pins: 2; RMS Current (Irms): 2.7A; Tolerance: 20%; Width: 4mm; ComponentLink1URL: https://datasheet.octopart.com:443/74438357100-Wurth-Elektronik-datasheet-168490252.pdf?src-supplier=Wurth+Elektronik; ComponentLink1Description: https://datasheet.octopart.com:443/74438357100-Wurth-Elektronik-datasheet-168490252.pdf?src-supplier=Wurth+Elektronik; ComponentLink2URL: https://datasheet.octopart.com:443/74438357100-W%C3%BCrth-Elektronik-datasheet-142051541.pdf?src-supplier=Upverter; ComponentLink2Description: https://datasheet.octopart.com:443/74438357100-W%C3%BCrth-Elektronik-datasheet-142051541.pdf?src-supplier=Upverter; ComponentLink3URL: https://datasheet.octopart.com:443/74438357100-W%C3%BCrth-Elektronik-datasheet-104453325.pdf?src-supplier=element14+APAC; ComponentLink3Description: https://datasheet.octopart.com:443/74438357100-W%C3%BCrth-Elektronik-datasheet-104453325.pdf?src-supplier=element14+APAC; Supplier 1: DigiKey; Supplier Part Number 1: 732-11206-1-ND; Manufacturer Part Number: 74438357100; Category: Fixed Inductors
LBL1 = THT-14-423-10: Thermal Transfer Printable Labels, 0.650" W x 0.200" H - 10,000 per roll; Manufacturer: Brady; SymbolCreator: a0412235; CompType: Label; SymbolVersion: 2012-06-12; ClassName: Label; PartNumber: THT-14-423-10; RoHS: Y; PackageReference: PCB Label 0.650"H x 0.200"W; MountType: N/A; ComponentLink1Description: Web Page; ComponentLink1URL: http://www.bradyid.com/bradyid/pdpv/THT-14-423-10.html; Note: Size: 0.65" x 0.20 "; Publisher: Texas Instruments; LatestRevisionDate: 2012-07-31; LatestRevisionNote: Initial Version; Alternate Manufacturer: -; Alternate PartNumber: -; Supplier 1: Farnell; Supplier Part Number 1: 2065596; Supplier 2: Newark; Supplier Part Number 2: 97C5133
MH1 = Mounting Hole: Mounting Holes M2.5 PTH; Diamétre externe: 5mm
NA1 = Net_Array: Ce Tableau Permet d'identifier les differentes Signaux
PCB_Fiche = PCB: Manufacturer: Any; PartNumber: VIB-DATALOGGER-001; SymbolCreator: a0412235; SymbolVersion: 2012-05-30; CompType: PCB; RoHS: O; MountType: N/A; Publisher: Texas Instruments; LatestRevisionDate: 2026/07/4; LatestRevisionNote: Initial Version; Alternate Manufacturer: -; Alternate PartNumber: -
POT1 RV1 = 3296W-1-103LF: TRIMMER 10K OHM 0.5W PC PIN TOP; Manufacturer: Bourns; Insulation Resistance: 1GΩ; Lead Diameter: 510µm; Lead Length: 6.4mm; Max Power Dissipation: 500mW; Number of Turns: 25; Resistance: 10kΩ; Temperature Coefficient: 100ppm/°C; Tolerance: 10%; Voltage Rating: 75V; Voltage Rating (AC): 300V; Case/Package: 0603; Case Code (Imperial): 0603; Case Code (Metric): 1608; China RoHS: Non-Compliant; Color: Blue; Composition: Cermet; Contact Plating: Tin; Country of Origin: Costa Rica; Depth: 4.83mm; Export Control Classification Number (ECCN) Code: EAR99; Height: 10.03mm; Harmonized Tariff Schedule (HTS) Code: 8533.40.80.50; Introduction Date: 2004-09-13; Lead Free: Lead Free; Length: 9.53mm; Lifecycle Status: Production; Max Operating Temperature: 125°C; Military Standard: Not; Min Operating Temperature: -55°C; Mount: Surface Mount; Number of Terminals: 3; Packaging: Tape and Reel; Power Rating: 500mW; Radiation Hardening: No; REACH SVHC: No; Schedule B: 8533400080, 8533400080|8533400080, 8533400080|8533400080|8533400080, 8533400080|8533400080|8533400080|8533400080; Taper: Linear; Termination: Pin; Voltage Rating (DC): 300V; Weight: 2.012816mg; Width: 4.83mm; Working Voltage: 300V; ComponentLink1URL: https://datasheet.octopart.com:443/3296W-1-103LF-Bourns-datasheet-154325949.pdf?src-supplier=Newark; ComponentLink1Description: https://datasheet.octopart.com:443/3296W-1-103LF-Bourns-datasheet-154325949.pdf?src-supplier=Newark; ComponentLink2URL: https://datasheet.octopart.com:443/3296W-1-103LF-Bourns-datasheet-134530165.pdf?src-supplier=Upverter; ComponentLink2Description: https://datasheet.octopart.com:443/3296W-1-103LF-Bourns-datasheet-134530165.pdf?src-supplier=Upverter; ComponentLink3URL: https://datasheet.octopart.com:443/3296W-1-103LF-Bourns-datasheet-8754025.pdf?src-supplier=Farnell; ComponentLink3Description: https://datasheet.octopart.com:443/3296W-1-103LF-Bourns-datasheet-8754025.pdf?src-supplier=Farnell; ComponentLink4URL: https://datasheet.octopart.com:443/3296W-1-103LF-Bourns-datasheet-9257.pdf?src-supplier=Farnell; ComponentLink4Description: https://datasheet.octopart.com:443/3296W-1-103LF-Bourns-datasheet-9257.pdf?src-supplier=Farnell; ComponentLink5URL: https://datasheet.octopart.com:443/3296W-1-103LF-Bourns-datasheet-8458046.pdf?src-supplier=Farnell; ComponentLink5Description: https://datasheet.octopart.com:443/3296W-1-103LF-Bourns-datasheet-8458046.pdf?src-supplier=Farnell; ComponentLink6URL: https://datasheet.octopart.com:443/3296W-1-103LF-Bourns-datasheet-6152.pdf?src-supplier=Farnell; ComponentLink6Description: https://datasheet.octopart.com:443/3296W-1-103LF-Bourns-datasheet-6152.pdf?src-supplier=Farnell; ComponentLink7URL: https://datasheet.octopart.com:443/3296W-1-103LF-Bourns-datasheet-528316.pdf?src-supplier=Farnell; ComponentLink7Description: https://datasheet.octopart.com:443/3296W-1-103LF-Bourns-datasheet-528316.pdf?src-supplier=Farnell; ComponentLink8URL: https://datasheet.octopart.com:443/3296W-1-103LF-Bourns-datasheet-62345832.pdf?src-supplier=element14+APAC; ComponentLink8Description: https://datasheet.octopart.com:443/3296W-1-103LF-Bourns-datasheet-62345832.pdf?src-supplier=element14+APAC; ComponentLink9URL: https://datasheet.octopart.com:443/3296W-1-103LF-Bourns-datasheet-25360155.pdf?src-supplier=Future+Electronics; ComponentLink9Description: https://datasheet.octopart.com:443/3296W-1-103LF-Bourns-datasheet-25360155.pdf?src-supplier=Future+Electronics; ComponentLink10URL: https://datasheet.octopart.com:443/3296W-1-103LF-Bourns-datasheet-154729564.pdf?src-supplier=Electro+Sonic; ComponentLink10Description: https://datasheet.octopart.com:443/3296W-1-103LF-Bourns-datasheet-154729564.pdf?src-supplier=Electro+Sonic; ComponentLink11URL: https://datasheet.octopart.com:443/3296W-1-103LF-Bourns-datasheet-8359740.pdf?src-supplier=_legacy+Avnet; ComponentLink11Description: https://datasheet.octopart.com:443/3296W-1-103LF-Bourns-datasheet-8359740.pdf?src-supplier=_legacy+Avnet; ComponentLink12URL: https://datasheet.octopart.com:443/3296W-1-103LF-Bourns-datasheet-170576125.pdf?src-supplier=Burklin+Elektronik; ComponentLink12Description: https://datasheet.octopart.com:443/3296W-1-103LF-Bourns-datasheet-170576125.pdf?src-supplier=Burklin+Elektronik; ComponentLink13URL: https://datasheet.octopart.com:443/3296W-1-103LF-Bourns-datasheet-14175298.pdf?src-supplier=iiiC; ComponentLink13Description: https://datasheet.octopart.com:443/3296W-1-103LF-Bourns-datasheet-14175298.pdf?src-supplier=iiiC; ComponentLink14URL: https://datasheet.octopart.com:443/3296W-1-103LF-Bourns-datasheet-7277272.pdf?src-supplier=Jameco; ComponentLink14Description: https://datasheet.octopart.com:443/3296W-1-103LF-Bourns-datasheet-7277272.pdf?src-supplier=Jameco; ComponentLink15URL: http://sigma.octopart.com:80/conflict_mineral_statement/Bourns-company-36.pdf?src-supplier=Compliance+Statements; ComponentLink15Description: http://sigma.octopart.com:80/conflict_mineral_statement/Bourns-company-36.pdf?src-supplier=Compliance+Statements; Supplier 1: DigiKey; Supplier Part Number 1: 3296W-103LF-ND; Manufacturer Part Number: 3296W-1-103LF; Category: Variable Resistors and Potentiometers
Q1 = CMP-1048-01269-2: NexarPartId: 354669; Manufacturer Lifecycle Status: ACTIVE; Collector Emitter Saturation Voltage: 500mV; Collector Emitter Breakdown Voltage: 80V; hFE Min: 25; Element Configuration: Single; Max Power Dissipation: 1.25W; Max Junction Temperature (Tj): 150°C; Emitter Base Voltage (VEBO): 5V; Max Collector Current: 1.5A; Number of Elements: 1; Polarity: NPN; Min Operating Temperature: -55°C; Max Operating Temperature: 150°C; Voltage Rating (DC): 80V; REACH SVHC: No SVHC; Radiation Hardening: No; Contact Plating: Tin; Schedule B: 8541290080, 8541290080; Number of Pins: 3; Case/Package: TO-225; Lifecycle Status: Production; Collector Base Voltage (VCBO): 80V; Weight: 4.535924g; Height: 11.04mm; RoHS: Compliant; Width: 2.66mm; Collector Emitter Voltage (VCEO): 80V; Lead Free: Lead Free; Current Rating: 1.5A; Power Dissipation: 1.25W; Packaging: Bulk; Length: 7.74mm